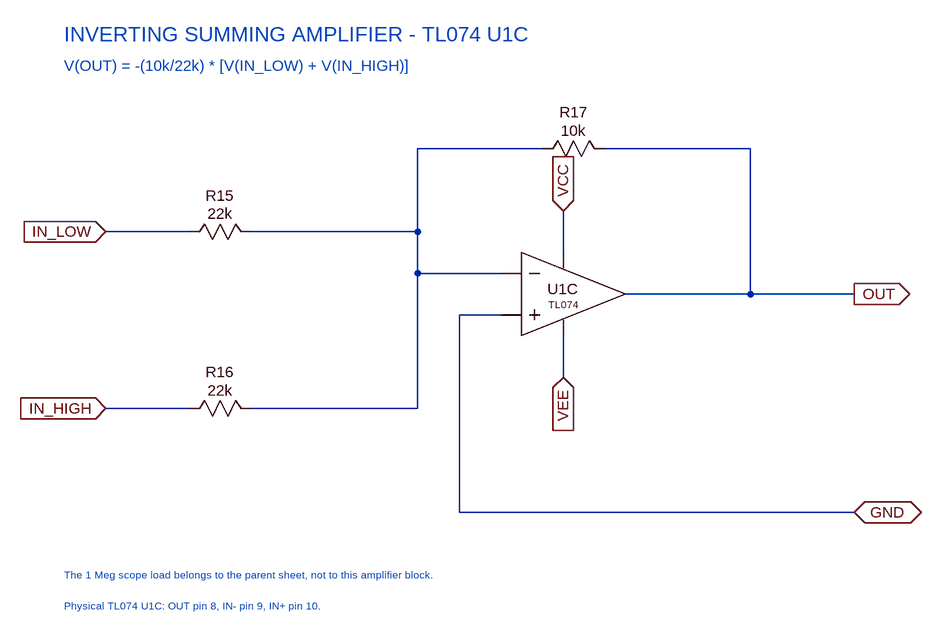
[diagram p0: schematic SummingAmplifier.asc]
SummingAmplifier.asc, the LTspice schematic file:
Version 4
SHEET 1 1472 1008
WIRE 928 416 1120 416
WIRE 1120 416 1280 416
WIRE 1120 416 1120 192
WIRE 1120 192 896 192
WIRE 800 192 608 192
WIRE 608 192 608 384
WIRE 608 384 736 384
WIRE 128 320 256 320
WIRE 352 320 608 320
WIRE 128 592 256 592
WIRE 352 592 608 592
WIRE 608 592 608 384
WIRE 736 448 672 448
WIRE 672 448 672 752
WIRE 672 752 1280 752
WIRE 832 352 832 288
WIRE 832 480 832 544
FLAG 1280 416 OUT
FLAG 128 320 IN_LOW
FLAG 128 592 IN_HIGH
FLAG 1280 752 GND
FLAG 832 288 VCC
FLAG 832 544 VEE
IOPIN 1280 416 Out
IOPIN 128 320 In
IOPIN 128 592 In
IOPIN 1280 752 BiDir
IOPIN 832 288 In
IOPIN 832 544 In
SYMBOL TL074_Channel 736 352 R0
SYMATTR InstName U1C
SYMBOL R_H 800 192 R0
SYMATTR InstName R17
SYMATTR Value 10k
SYMBOL R_H 256 320 R0
SYMATTR InstName R15
SYMATTR Value 22k
SYMBOL R_H 256 592 R0
SYMATTR InstName R16
SYMATTR Value 22k
TEXT 64 16 Left 3 ;INVERTING SUMMING AMPLIFIER - TL074 U1C
TEXT 64 64 Left 2 ;V(OUT) = -(10k/22k) * [V(IN_LOW) + V(IN_HIGH)]
TEXT 64 848 Left 1 ;The 1 Meg scope load belongs to the parent sheet, not to this amplifier block.
TEXT 64 896 Left 1 ;Physical TL074 U1C: OUT pin 8, IN- pin 9, IN+ pin 10.

The netlist it stands for:
* SummingAmplifier.asc
XU1C GND N001 VCC VEE OUT TL074  ; pins IN+ IN- VCC VEE OUT
R17 N001 OUT 10k
R15 IN_LOW N001 22k
R16 IN_HIGH N001 22k
* INVERTING SUMMING AMPLIFIER - TL074 U1C
* V(OUT) = -(10k/22k) * [V(IN_LOW) + V(IN_HIGH)]
* The 1 Meg scope load belongs to the parent sheet, not to this amplifier block.
* Physical TL074 U1C: OUT pin 8, IN- pin 9, IN+ pin 10.
.backanno
.end